# Altium schematic sheet X.SchDoc
size A4
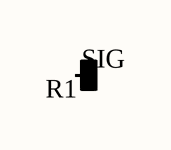
[diagram p0: X.SchDoc]

## Parts
R1  (no value)

## Ports
P

## Nets
SIG: R1.1(A) ; port P

## Library data of the parts
R1 = RES